# EAGLE design EPGinputRelay1 (EAGLE 7.7.0)
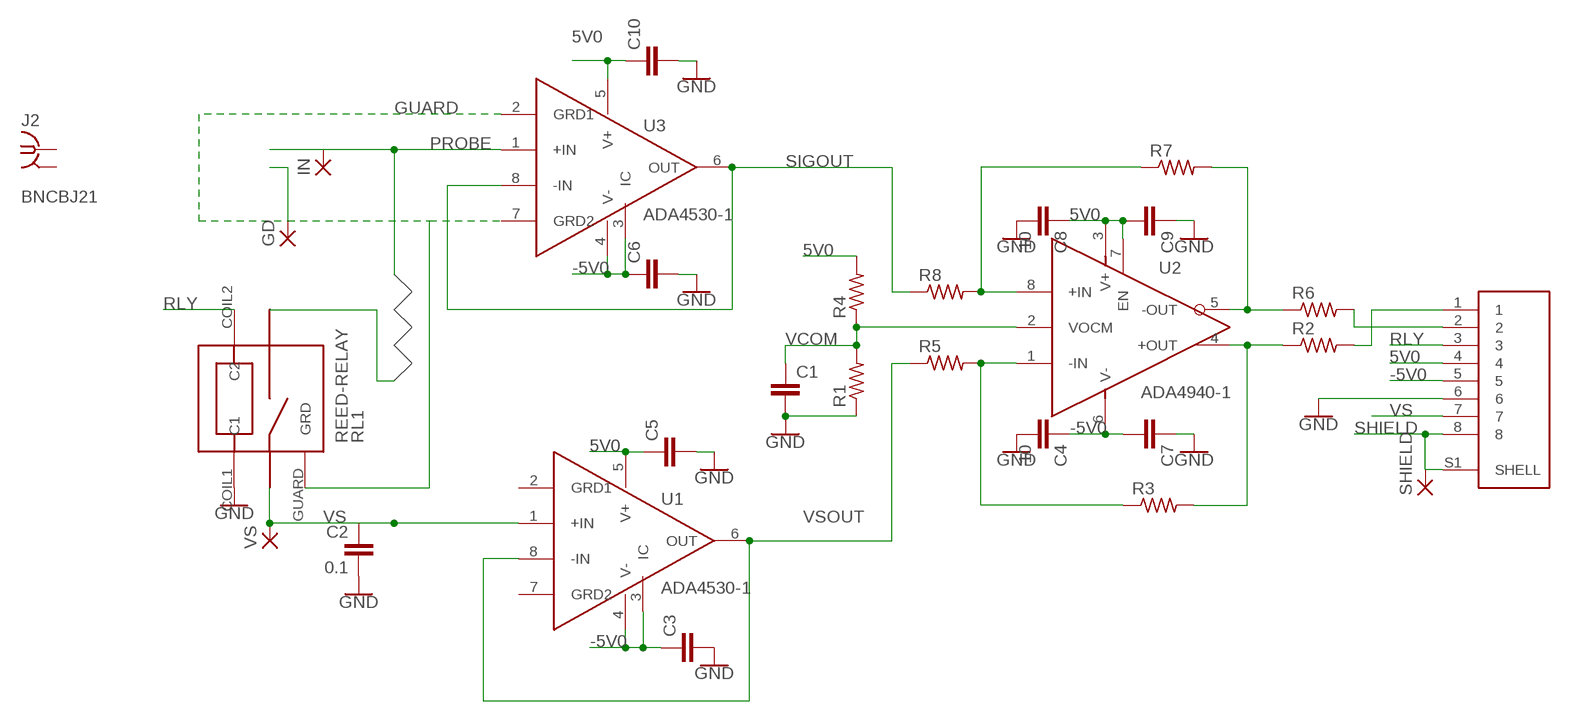
[diagram p0: schematic, sheet 1]

## Parts
C1  CAPS0603S  [0603S]
C2  0.1  CAPS0603S  [0603S]
C3  CAPS0603S  [0603S]
C4  10  CAPS1206S  [1206S]
C5  CAPS0603S  [0603S]
C6  CAPS0603S  [0603S]
C7  CAPS0603S  [0603S]
C8  10  CAPS1206S  [1206S]
C9  CAPS0603S  [0603S]
C10  CAPS0603S  [0603S]
GD  2,15/1,0  [2,15/1,0]
IN  SMD2  [SMD1,27-2,54]
J1  54-00248  [TENSILITY_54-00248]
J2  BNCBJ21  [BNC-BJ21]
R1  RESISTOR_SM0805S  [0805S]
R2  RESISTOR_SM0805S  [0805S]
R3  RESISTOR_SM0805S  [0805S]
R4  RESISTOR_SM0805S  [0805S]
R5  RESISTOR_SM0805S  [0805S]
R6  RESISTOR_SM0805S  [0805S]
R7  RESISTOR_SM0805S  [0805S]
R8  RESISTOR_SM0805S  [0805S]
RL1  REED-RELAY  [MRE05]
SHIELD  2,15/1,0  [2,15/1,0]
U1  ADA4530-1  [SOIC-8]
U2  ADA4940-1  [SOIC-8]
U3  ADA4530-1  [SOIC-8]
VS  2,15/1,0  [2,15/1,0]

## Nets
5V0: C5.1 C8.1 C9.2 C10.1 J1.4 R4.2 U1.5(V+) U2.3(V+) U2.7(EN) U3.5(V+)
-5V0: C3.1 C4.1 C6.1 C7.2 J1.5 U1.3(IC) U1.4(V-) U2.6(V-) U3.3(IC) U3.4(V-)
GND: C1.2 C2.2 C3.2 C4.2 C5.2 C6.2 C7.1 C8.2 C9.1 C10.2 J1.6 R1.1 RL1.COIL1(C1)
GUARD: GD.1(P) RL1.GUARD(GRD) U3.2(GRD1) U3.7(GRD2)
N$6: R7.1 R8.2 U2.8(+IN)
N$7: R3.1 R5.2 U2.1(-IN)
N$9: J1.2 R6.2
N$10: J1.1 R2.2
N$19: R2.1 R3.2 U2.4(+OUT)
N$20: R6.1 R7.2 U2.5(-OUT)
PROBE: IN.1(P) U3.1(+IN)
RLY: J1.3 RL1.COIL2(C2)
SHIELD: J1.8 J1.S1(SHELL) SHIELD.1(P)
SIGOUT: R8.1 U3.6(OUT) U3.8(-IN)
VCOM: C1.1 R1.2 R4.1 U2.2(VOCM)
VS: C2.1 J1.7 U1.1(+IN) VS.1(P)
VSOUT: R5.1 U1.6(OUT) U1.8(-IN)
Unconnected: J2.P$1(GND) J2.P$2 U1.2(GRD1) U1.7(GRD2)

## Library data of the parts
C1-C10 = STEVES_BU:CAPS
GD SHIELD VS = wirepad:2,15/1,0: THROUGH-HOLE PAD
IN = wirepad:SMD2: SMD PAD
J1 = 54-00248:54-00248
J2 = STEVES_BU:BNC
R1-R8 = STEVES_BU:RESISTOR_SM
RL1 = EPGinput:REED-RELAY
U1 U3 = EPG:ADA4530-1
U2 = EPG:ADA4940-1

## Board
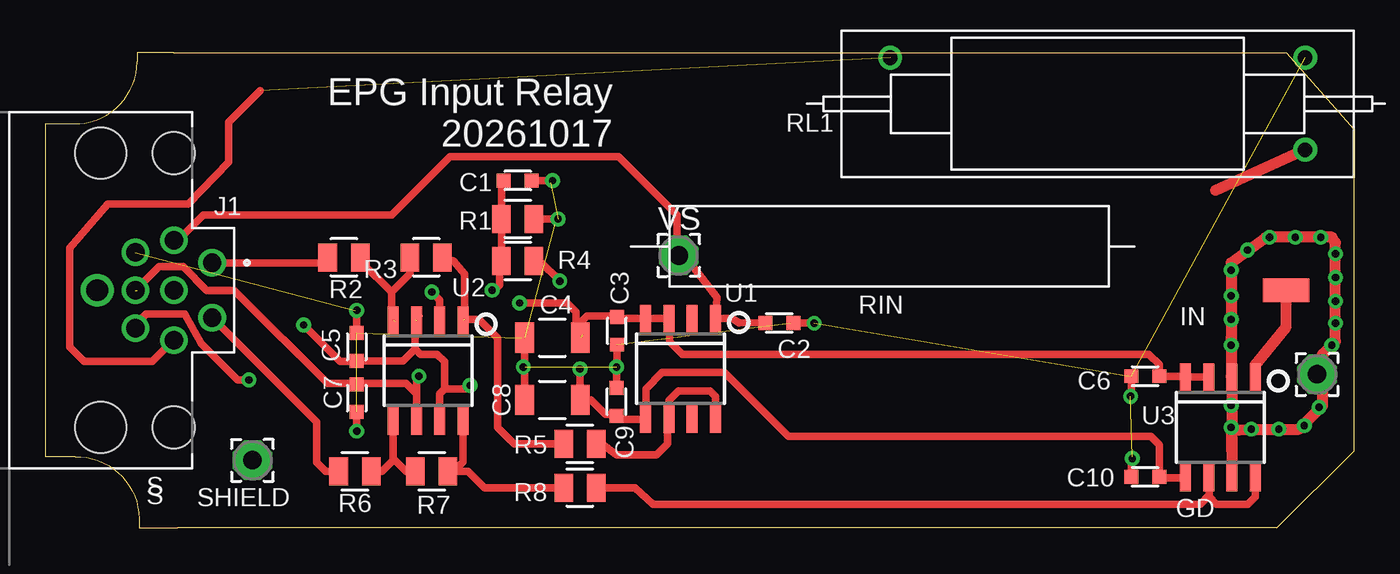
[diagram p1: board, top side]
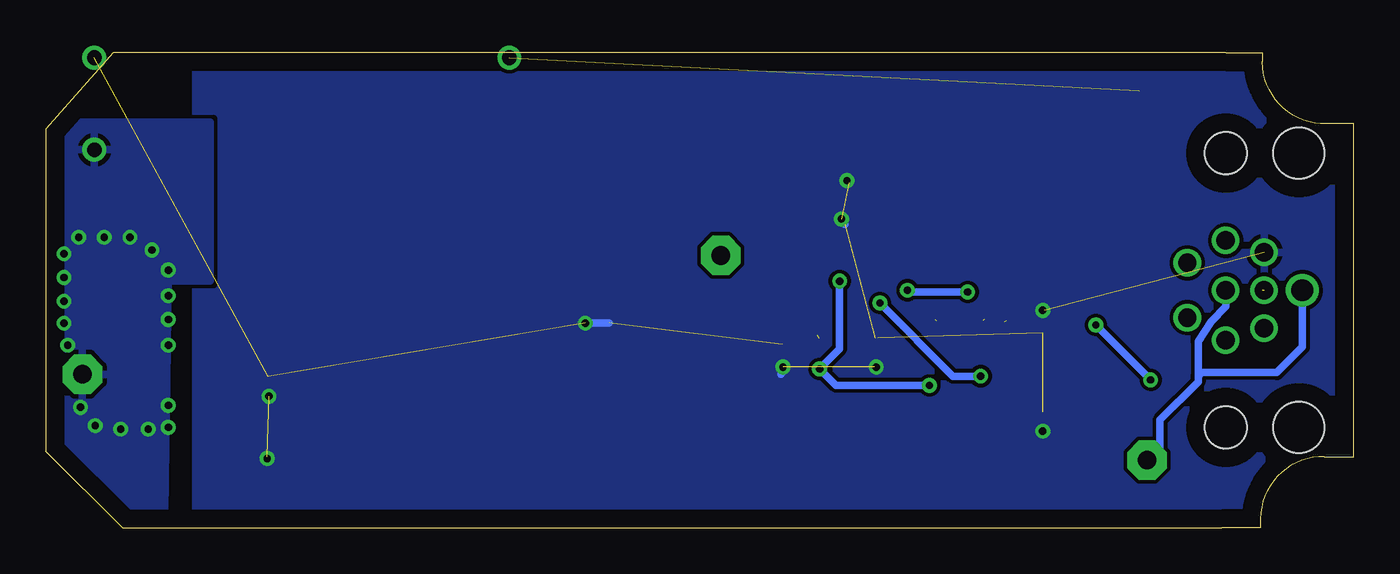
[diagram p2: board, bottom side, seen from below]

Size 71.5 x 26 mm. Coordinates in mm from the lower left corner, seen from the top.
Outline: 0,3.9 0,22.1 1.5,22.1 arc91 5,25.5 5,26 7,26 67.8,26 71.5,21.8 71.5,4.2 67.3,0 7.2,0 5.1,0 5.1,0.5 arc91 1.6,3.9 0,3.9
Copper layers (1*16): Top 0.035mm / dielectric 1.5mm / Bottom 0.035mm
Design rules "default *": minimum track width 10mil, minimum drill 15mil, track to track 8mil, track to pad 8mil, pad to pad 8mil, via to via 8mil, smd to smd 8mil, copper to edge 40mil, drill to drill 8mil, minimum pad ring 10mil, minimum via ring 8mil, stop-mask expansion 4mil, vias tented up to drill 0mil, thermal gap 10mil

### Footprints (pad centres in the part's own frame; a part is rotated, then mirrored left to right if it is on the bottom)
0603S = smd 0.762 x 0.762: 1 -0.762,0; 2 0.762,0
1206S = smd 1.016 x 1.651: 1 -1.524,0; 2 1.524,0
2,15/1,0 = drill 1.016 pad 2.159 octagon: 1 0,0
SMD1,27-2,54 = smd 1.27 x 2.54: 1 0,0
TENSILITY_54-00248 = drill 1 pad 1.4: 1 -1.5,2.1; 2 1.5,2.1; 3 2.725,0; 4 2.075,-2.1; 5 0,-2.1; 6 -2.075,-2.1; 7 -2.725,0; 8 0,0 | drill 1.2 pad 1.7: S1 0,-4.191 | hole 2.3: -7.5,0; 7.5,0 | hole 2.8: -7.5,-4; 7.5,-4
BNC-BJ21 = smd 0.635 x 1.27: P$1 0,12.954; P$2 0,8.128
0805S = smd 1.016 x 1.524: 1 -0.889,0; 2 0.889,0
MRE05 = drill 0.8: COIL1 -11.34,-2.52; COIL2 11.34,-2.52; GUARD -11.34,2.52
SOIC-8 = smd 0.6 x 1.5: 1 -1.905,-2.75; 2 -0.635,-2.75; 3 0.635,-2.75; 4 1.905,-2.75; 5 1.905,2.75; 6 0.635,2.75; 7 -0.635,2.75; 8 -1.905,2.75

### Placement (x,y rotation side)
C1  25.8,19 0 top
C2  40.1,11.2 0 top
C3  31.22,10.79 270 top
C4  27.7,10.4 180 top
C5  17,9.9 90 top
C6  60.1,8.3 180 top
C7  17,7.1 90 top
C8  27.7,7 180 top
C9  31.2,6.9 270 top
C10  60.1,2.8 180 top
GD  69.5,8.4 180 top
IN  67.8,13 270 top
J1  7,13 270 top
J2  71.8,13 270 top  (outside the outline)
R1  25.8,16.9 180 top
R2  16.3,14.8 180 top
R3  20.8,14.8 180 top
R4  25.8,14.6 0 top
R5  29.2,4.6 180 top
R6  16.9,3.1 180 top
R7  21.1,3.1 180 top
R8  29.2,2.2 180 top
RIN  [1GRES]  46.1,15.4 180 top
RL1  57.5,23.2 180 top
SHIELD  11.3,3.7 180 top
U1  34.7,8.7 180 top
U2  20.9,8.6 180 top
U3  64.2,5.5 180 top
VS  34.6,14.9 0 top

### Tracks (layer width: path | path; a pad name or v marks a point on that pad's centre or on a via)
5V0  (via drill 0.4)  (1 unrouted)
  Top 0.406: U3.5 60.91,2.75 C10.1 60.86,4.54 60.4,5 40.6,5 37.1,8.5 33.7,8.5 32.8,7.6 32.8,5.9 32.9,5.8 32.9,5.84 U1.5 31.61,5.95 C9.2 31.24,6.2 30.6,6.2 29.8,7 C8.1 29.2,7.02 v29.2,8.7 | 20.2,9.8 19.54,9.14 C5.1 16.94,9.14 16.9,9.1 16.1,9.1 v14.1,11.1 | 20.2,9.8 20.2,11.4 20.3,11.5 20.4,11.6 | U2.7 21.54,7.33 21.8,7.6 | 21.8,7.6 21.8,9.1 21.4,9.5 20.5,9.5 20.2,9.8 | 21.8,7.6 23,7.6 v23.2,7.8 | R4.2 27,14.6 v28.1,13.5 | v11.1,8.1 10.5,8.1 8.5,10.1 7.6,11.7 5.5,11.7 4.9,11.1 J1.4
  Bottom 0.406: v23.2,7.8 28.3,7.8 v29.2,8.7 28.1,9.8 v28.1,13.5 | v14.1,11.1 v11.1,8.1
-5V0  (via drill 0.4)  (2 unrouted)
  Top 0.406: U3.3 U3.4 62.24,8.3 C6.1 60.86,8.94 60.3,9.5 34.8,9.5 34.1,10.2 34.1,11.41 U1.3 U1.4 31.32,11.45 C3.1 31.25,11.55 31.3,11.6 29.6,11.6 29.2,11.2 29.2,10.7 29.35,10.55 | 29.35,10.55 29.5,10.4 | U2.6 20.27,7.33 | 20.27,7.33 19.7,7.9 17.1,7.9 | 17.1,7.9 17.04,7.9 C7.2 | 20.27,7.33 20.27,8.16 v20.4,8.3 | v25.9,12.3 28.5,12.3 29,11.8 29,10.9 29.35,10.55 | 17.1,7.9 15.4,7.9 10.5,12.8 10.3,13 8.8,13 7.5,14.3 6.2,14.3 5,13.1 5,13
  Bottom 0.406: v20.4,8.3 21.9,8.3 v25.9,12.3
GND  (via drill 0.4)  (10 unrouted)
  Top 0.406: C6.2 59.34,7.46 v59.3,7.2 | C10.2 59.34,3.74 v59.4,3.8 | C9.1 31.26,7.66 31.2,7.7 31.2,8.5 v31.2,8.8 31.22,8.82 C3.2 | C5.2 v17,11.9 | C7.1 v17,5.3 | C8.2 26.18,8.8 | 26.18,8.8 26.18,10.22 26,10.4 | C4.2 26.18,8.8 | 26.18,8.8 v26.1,8.8 | C2.2 v42,11.2 | C1.2 v27.7,19 | R1.1 v28,16.9
  Bottom 0.406: v59.3,7.2 59.3,7.4 59.2,7.3 | v59.4,3.8 59.4,3.9 | v31.2,8.8 31.3,8.4 | v17,11.9 16.9,11.9 | v17,5.3 16.9,5.3 | v26.1,8.8 26.2,8.8 | v42,11.2 40.7,11.2 | v27.7,19 27.6,18.9 | v28,16.9 28,16.8 27.8,16.6
  pour Bottom (rank 2): 63.3,-0.7 -3.7,-0.9 -3.6,25.6 63.3,26.6
GUARD  (via drill 0.4)
  Top 0.61: U3.2 64.83,5.33 | 64.83,5.33 64.83,4.16 | 64.83,4.16 U3.7 | 64.83,4.16 64.83,5.33 | 64.83,5.33 65.7,5.4 v65.9,5.4 v67.4,5.4 68.5,5.4 69.8,6.7 69.8,8.1 | 69.8,8.1 69.8,9.5 70.5,10.2 v70.5,11.2 v70.5,12.4 v70.5,13.7 v70.5,15 70.5,15.6 70.3,15.9 v69.7,15.9 v68.3,15.9 v66.9,15.9 66.7,15.9 66.6,15.8 64.8,14.5 v64.8,14.1 v64.8,12.7 v64.8,11.4 v64.8,10 64.8,10.4 64.8,9.9 64.8,8.3 | GD.1 69.8,8.1 | RL1.GUARD 63.94,18.46
  other vias: 65.7,15.2 70.3,10 64.8,6.7 64.8,5.5 68.8,5.6 69.6,6.6
  pour Bottom (isolate 1): 72.7,1 65,0.8 64.8,13.5 62.5,13.5 62.5,22.2 72.5,22.2
N$6
  Top 0.406: R8.2 24,2.2 23.1,3.1 22.3,3.1 | 22.3,3.1 R7.1 | U2.8 22.8,3.61 22.3,3.1
N$7  (1 unrouted)
  Top 0.406: R5.2 25.6,4.6 24.7,5.5 24.7,10.4 23.7,11.4 22.9,11.4 22.9,13.9 22.3,14.6 R3.1
N$9
  Top 0.406: R6.2 15.3,3.1 14.8,3.6 14.8,5.8 J1.2
N$10
  Top 0.406: R2.2 15.1,14.5 J1.1
N$19  (1 unrouted)
  Top 0.406: R3.2 19.91,13.91 18.9,12.9 | 18.9,12.9 18.9,11.5 19.1,11.3 | R2.1 17.3,14.5 18.9,12.9
N$20
  Top 0.406: R7.2 19.7,3.1 19.05,3.75 | 19.05,3.75 19,3.8 U2.5 | R6.1 18.4,3.1 19.05,3.75
PROBE
  Top 0.61: U3.1 66.11,8.91 67.8,11 IN.1
RLY  (1 unrouted)
  Top 0.406: 11.72,23.92 10,22.2 10,20 7.8,17.7 3.4,17.7 1.3,15.3 1.3,9.9 2.1,9.1 5.83,9.1 J1.3
SHIELD
  Bottom 0.406: J1.8 7,12.1 7.8,11.3 8.5,10.2 8.5,8.3 | 8.5,8.3 8.5,8 10.6,5.9 10.6,4.4 SHIELD.1 | J1.S1 2.81,9.89 4.2,8.5 8.3,8.5 8.5,8.3
SIGOUT
  Top 0.406: U3.8 66.11,1.71 65.7,1.3 64,1.3 63.6,1.7 63.6,1.8 | 63.6,1.8 63.6,2.71 U3.6 | 63.6,1.8 63.1,1.3 33.2,1.3 32.2,2.2 R8.1
VCOM  (via drill 0.4)
  Top 0.406: U2.2 21.54,12.46 v21.1,12.9 | v24.4,13 24.5,13 24.8,13.3 24.8,14.2 25.1,14.5 25.01,14.5 R4.1 R1.2 24.91,18.87 C1.1
  Bottom 0.406: v21.1,12.9 24.3,12.9 v24.4,13
VS
  Top 0.406: C2.1 37.9,11.24 37.9,11.2 37.55,11.45 U1.1 36.7,12.6 35,14.8 VS.1 34.5,15 34.5,17.1 31.3,20.3 22.1,20.3 18.9,17.1 8.6,17.1 7.22,15.72 J1.7
VSOUT
  Top 0.406: U1.8 36.6,7.2 36.3,7.5 34.6,7.5 34.06,6.96 U1.6 34,5.88 34,4.6 33.4,4 31.2,4 30.4,4.6 R5.1

### Text on the board
tPlace: EPG Input Relay / 20261017 | S | S